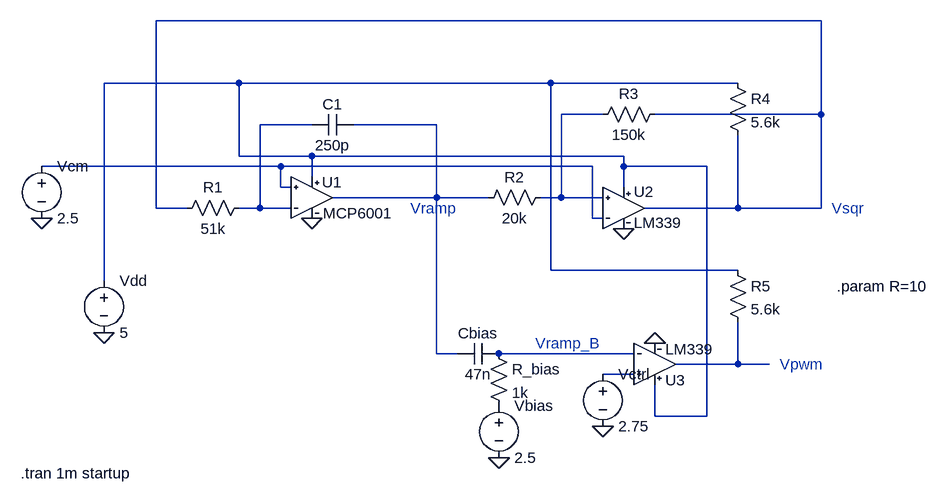
[diagram p0: schematic Exp1.asc]
Exp1.asc, the LTspice schematic file:
Version 4.1
SHEET 1 880 680
WIRE 496 -544 -528 -544
WIRE -400 -448 -608 -448
WIRE 80 -448 -400 -448
WIRE 368 -448 80 -448
WIRE 160 -400 96 -400
WIRE 496 -400 496 -544
WIRE 496 -400 240 -400
WIRE -288 -384 -368 -384
WIRE -96 -384 -224 -384
WIRE -400 -336 -400 -448
WIRE -288 -336 -400 -336
WIRE 192 -336 -288 -336
WIRE -336 -320 -704 -320
WIRE 144 -320 -336 -320
WIRE 192 -320 192 -336
WIRE 320 -320 192 -320
WIRE -288 -304 -288 -336
WIRE -336 -288 -336 -320
WIRE -320 -288 -336 -288
WIRE 192 -288 192 -320
WIRE -96 -272 -96 -384
WIRE -96 -272 -256 -272
WIRE -16 -272 -96 -272
WIRE 96 -272 96 -400
WIRE 96 -272 64 -272
WIRE 160 -272 96 -272
WIRE -528 -256 -528 -544
WIRE -480 -256 -528 -256
WIRE -368 -256 -368 -384
WIRE -368 -256 -400 -256
WIRE -320 -256 -368 -256
WIRE 368 -256 368 -368
WIRE 368 -256 224 -256
WIRE 496 -256 496 -400
WIRE 496 -256 368 -256
WIRE 144 -240 144 -320
WIRE 160 -240 144 -240
WIRE 80 -160 80 -448
WIRE 368 -160 80 -160
WIRE -608 -144 -608 -448
WIRE -96 -32 -96 -272
WIRE -64 -32 -96 -32
WIRE 208 -32 0 -32
WIRE 368 -16 368 -80
WIRE 368 -16 272 -16
WIRE 416 -16 368 -16
WIRE 208 0 160 0
WIRE 240 64 240 16
WIRE 320 64 320 -320
WIRE 320 64 240 64
FLAG -704 -240 0
FLAG 160 80 0
FLAG 0 128 0
FLAG -608 -64 0
FLAG -288 -240 0
FLAG 192 -224 0
FLAG 240 -48 0
SYMBOL MCP6001 -288 -272 R0
SYMATTR InstName U1
SYMBOL voltage -608 -160 R0
SYMATTR InstName Vdd
SYMATTR Value 5
SYMBOL res -384 -272 R90
WINDOW 0 0 56 VBottom 2
WINDOW 3 32 56 VTop 2
SYMATTR InstName R1
SYMATTR Value 51k
SYMBOL cap -224 -400 R90
WINDOW 0 0 32 VBottom 2
WINDOW 3 32 32 VTop 2
SYMATTR InstName C1
SYMATTR Value 250p
SYMBOL res 80 -288 R90
WINDOW 0 0 56 VBottom 2
WINDOW 3 32 56 VTop 2
SYMATTR InstName R2
SYMATTR Value 20k
SYMBOL cap 0 -48 R90
WINDOW 0 0 32 VBottom 2
WINDOW 3 32 32 VTop 2
SYMATTR InstName Cbias
SYMATTR Value 47n
SYMBOL res -16 -48 R0
SYMATTR InstName R_bias
SYMATTR Value 1k
SYMBOL LM339 224 -256 R0
SYMATTR InstName U2
SYMBOL LM339 272 -16 M180
SYMATTR InstName U3
SYMBOL res 256 -416 R90
WINDOW 0 0 56 VBottom 2
WINDOW 3 32 56 VTop 2
SYMATTR InstName R3
SYMATTR Value 150k
SYMBOL voltage -704 -336 R0
SYMATTR InstName Vcm
SYMATTR Value 2.5
SYMBOL voltage 0 32 R0
SYMATTR InstName Vbias
SYMATTR Value 2.5
SYMBOL voltage 160 -16 R0
WINDOW 123 0 0 Left 0
WINDOW 39 0 0 Left 0
SYMATTR InstName Vctrl
SYMATTR Value 2.75
SYMBOL res 352 -464 R0
SYMATTR InstName R4
SYMATTR Value 5.6k
SYMBOL res 352 -176 R0
SYMATTR InstName R5
SYMATTR Value 5.6k
TEXT -136 -256 Left 2 ;Vramp
TEXT 512 -256 Left 2 ;Vsqr
TEXT 432 -16 Left 2 ;Vpwm
TEXT 56 -48 Left 2 ;Vramp_B
TEXT 520 -136 Left 2 !.param R=10
TEXT -736 152 Left 2 !.tran 1m startup

The netlist it stands for:
* Exp1.asc
X§U1 N006 N004 N002 0 N005 MCP6001
Vdd N002 0 5
R1 N004 N001 51k
C1 N005 N004 250p
R2 N003 N005 20k
Cbias N007 N005 47n
R_bias N007 P001 1k
X§U2 N003 N006 N002 0 N001 LM339
X§U3 N009 N007 N002 0 N008 LM339
R3 N001 N003 150k
Vcm N006 0 2.5
Vbias P001 0 2.5
Vctrl N009 0 2.75
R4 N002 N001 5.6k
R5 N002 N008 5.6k
* Vramp
* Vsqr
* Vpwm
* Vramp_B
.param R=10
.tran 1m startup
.lib ./MCP6001.lib
.lib ./LM339.lib
.backanno
.end